# Altium schematic sheet RS485_2.SchDoc
size 300 x 200 mm; SheetNumber: 4; SheetTotal: 11
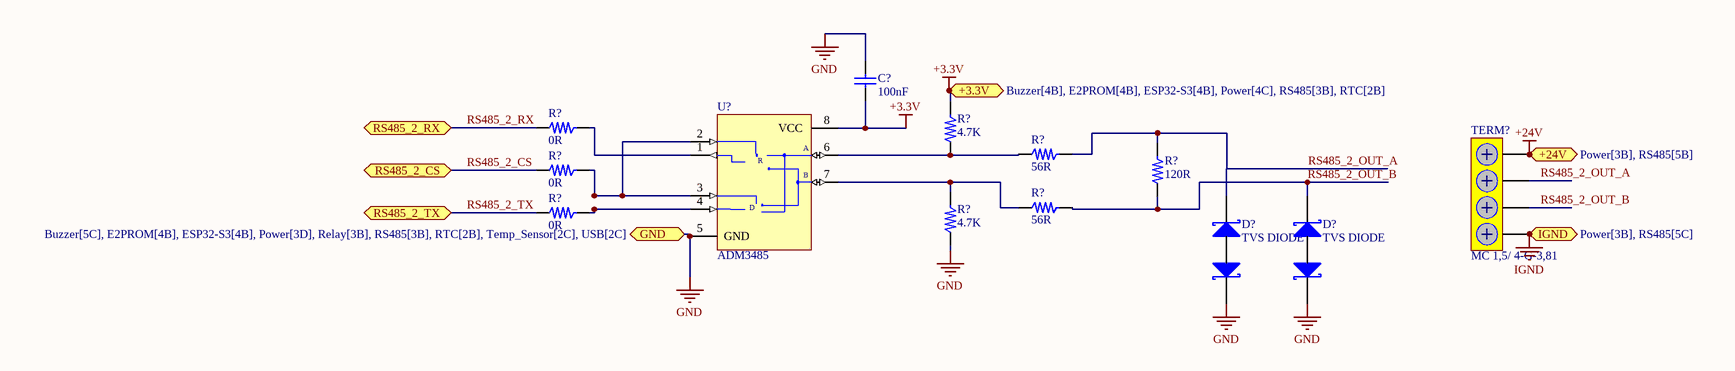
[diagram p0: RS485_2.SchDoc]

## Parts
(Parts that share a designator on the sheet are numbered #1, #2 ... from top to bottom, then left to right.)
C?  100nF  [0805]
D?#1  TVS DIODE  [DO-214AA]
D?#2  TVS DIODE  [DO-214AA]
R?#1  0R  [R0805]
R?#2  4.7K  [R0805]
R?#3  56R  [R0805]
R?#4  0R  [R0805]
R?#5  120R  [R0805]
R?#6  0R  [R0805]
R?#7  56R  [R0805]
R?#8  4.7K  [R0805]
TERM?  MC 1,5/ 4-G-3,81  [MC 1,5/ 4-G-3,81]
U?  ADM3485  [NSO8_N]

## Ports
+3.3V (bidir, see Buzzer[4B], E2PROM[4B], ESP32-S3[4B], Power[4C], RS485[3B], RTC[2B]), +24V (bidir, see Power[3B], RS485[5B]), GND (bidir, see Buzzer[5C], E2PROM[4B], ESP32-S3[4B], Power[3D], Relay[3B], RS485[3B], RTC[2B], Temp_Sensor[2C], USB[2C]), IGND (bidir, see Power[3B], RS485[5C]), RS485_2_CS (bidir), RS485_2_RX (bidir), RS485_2_TX (bidir)

## Nets
+3.3V: C?.1 R?#2.2 U?.8(VCC) ; port +3.3V
+24V: TERM?.1 ; port +24V
GND: C?.2 D?#1.1 D?#2.1 R?#8.1 U?.5(GND) ; port GND
IGND: TERM?.4 ; port IGND
RS485_2_CS: R?#4.1 ; port RS485_2_CS
RS485_2_OUT_A: D?#1.2 R?#3.2 R?#5.2 TERM?.2
RS485_2_OUT_B: D?#2.2 R?#5.1 R?#7.2 TERM?.3
RS485_2_RX: R?#1.1 ; port RS485_2_RX
RS485_2_TX: R?#6.1 ; port RS485_2_TX
NetR?#1_2: R?#1.2 U?.1(RO)
NetR?#2_1: R?#2.1 R?#3.1 U?.6(A)
NetR?#4_2: R?#4.2 U?.2(~{RE}) U?.3(DE)
NetR?#6_2: R?#6.2 U?.4(DI)
NetR?#7_1: R?#7.1 R?#8.2 U?.7(B)

## Notes on the sheet
- (in symbol MAX485CSA) R; D

## Library data of the parts
C? = 2-Cap: Bipolar Capacitor; Type: MKT
R?#1-R?#8 = myRes_1
  R?#1 R?#4 R?#6: Value: 0R
  R?#2 R?#8: Value: 4.7K
  R?#3 R?#7: Value: 56R
  R?#5: Value: 120R
U? = MAX485CSA: Low-Power, Slew-Rate-Limited RS-485/RS-422 Transceiver; Published: 16-Jan-2001; LatestRevisionDate: 13-Apr-2006; LatestRevisionNote: IPC-7351 Footprint Added.; DatasheetVersion: Feb-1996; PackageReference: NSO8; Publisher: Altium Limited; PackageDescription: 8-Pin Small Outline Integrated Circuit 1.27 mm Pitch; Code_JEDEC: MS-012-AA; Code_IPC: SOIC127P600-8; ComponentLink1Description: Manufacturer Link; ComponentLink1URL: http://www.maxim-ic.com/; ComponentLink2Description: Datasheet; ComponentLink2URL: http://pdfserv.maxim-ic.com/en/ds/MAX1487-MAX491.pdf